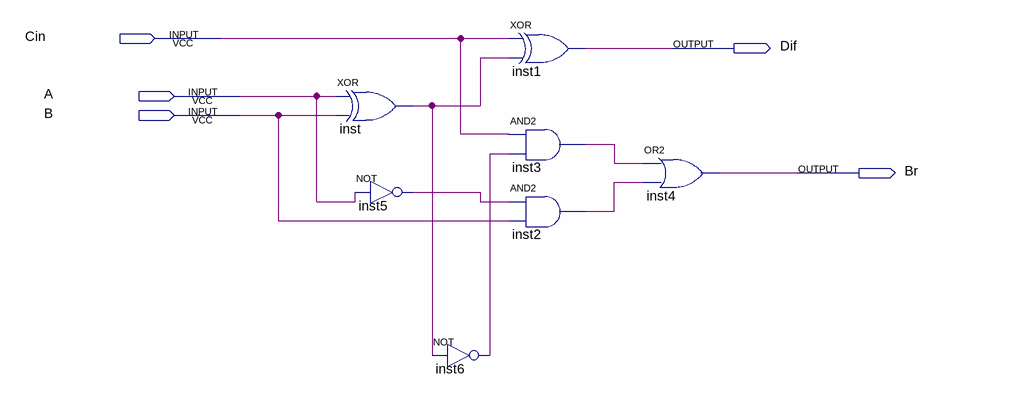
[diagram p0: schematic sheet]
// Quartus schematic FullSubtractor.bdf as structural Verilog: 7 symbols, 5 pins
module FullSubtractor (
  input  Cin,
  input  A,
  input  B,
  output Dif,
  output Br
);

  wire inst2_out, inst3_out, inst5_out, inst6_out, inst_out;

  xor inst (inst_out, A, B);
  not inst5 (inst5_out, A);
  not inst6 (inst6_out, inst_out);
  xor inst1 (Dif, Cin, inst_out);
  and inst3 (inst3_out, Cin, inst6_out);
  and inst2 (inst2_out, inst5_out, B);
  or inst4 (Br, inst3_out, inst2_out);
endmodule
